# Altium schematic sheet Connectors and Vehicle Interfacing.SchDoc
size A; SheetNumber: 1; SheetTotal: 4
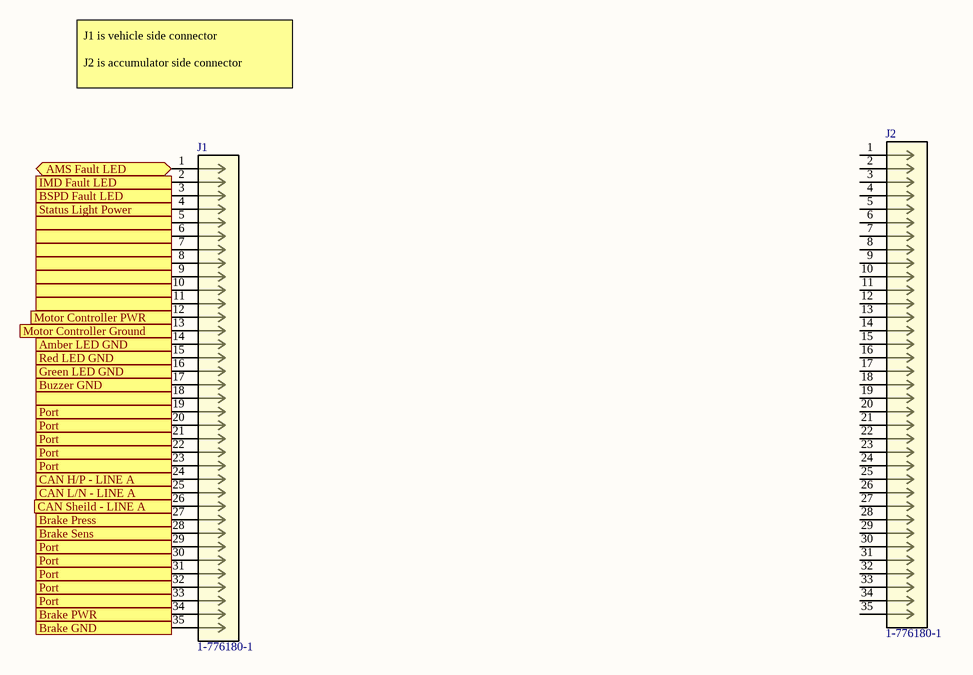
[diagram p0: Connectors and Vehicle Interfacing.SchDoc]

## Parts
J1  1-776180-1  [CONN35_776180_TEC]
J2  1-776180-1  [CONN35_776180_TEC]

## Ports
 (out), Amber LED GND, AMS Fault LED (bidir), Brake GND, Brake Press, Brake PWR, Brake Sens, BSPD Fault LED (out), Buzzer GND, CAN H/P - LINE A, CAN L/N - LINE A, CAN Sheild - LINE A, Green LED GND, IMD Fault LED (out), Motor Controller Ground, Motor Controller PWR, Port, Red LED GND, Status Light Power (out), 

## Nets
Amber LED GND: J1.14 ; port Amber LED GND
AMS Fault LED: J1.1 ; port AMS Fault LED
Brake GND: J1.35 ; port Brake GND
Brake Press: J1.27 ; port Brake Press
Brake PWR: J1.34 ; port Brake PWR
Brake Sens: J1.28 ; port Brake Sens
BSPD Fault LED: J1.3 ; port BSPD Fault LED
Buzzer GND: J1.17 ; port Buzzer GND
CAN H/P - LINE A: J1.24 ; port CAN H/P - LINE A
CAN L/N - LINE A: J1.25 ; port CAN L/N - LINE A
CAN Sheild - LINE A: J1.26 ; port CAN Sheild - LINE A
Green LED GND: J1.16 ; port Green LED GND
IMD Fault LED: J1.2 ; port IMD Fault LED
Motor Controller Ground: J1.13 ; port Motor Controller Ground
Motor Controller PWR: J1.12 ; port Motor Controller PWR
Port: J1.19 J1.20 J1.21 J1.22 J1.23 J1.29 J1.30 J1.31 J1.32 J1.33 ; port Port
Red LED GND: J1.15 ; port Red LED GND
Status Light Power: J1.4 ; port Status Light Power
NetJ1_5: J1.5 J1.6 J1.7 J1.8 J1.9 J1.10 J1.11 J1.18 ; port 

Not connected (* = marked no-connect by the designer): J2 1 2 3 4 5 6 7 8 9 10 11 12 13 14 15 16 17 18 19 20 21 22 23 24 25 26 27 28 29 30 31 32 33 34 35

## Notes on the sheet
- J1 is vehicle side connector
  J2 is accumulator side connector

## Library data of the parts
J1 J2 = 1-776180-1: 35POS,PIN DIA 1.3,HDR ASSY,90DEG,COD 1; Manufacturer_Name: TE Connectivity; TYPE: -; Copyright: Copyright (C) 2026 Ultra Librarian. All rights reserved.; Manufacturer_Part_Number: 1-776180-1; Datasheet: https://www.te.com/commerce/DocumentDelivery/DDEController?Action=srchrtrv&DocNm=1-1773950-7&DocType=Data+Sheet&DocLang=English&PartCntxt=1418882-1&DocFormat=pdf; RefDes: RefDes